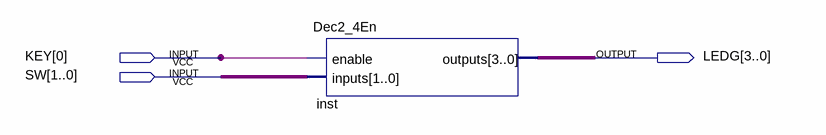
[diagram p0: schematic sheet]
// Quartus schematic Dec2_4En_1.bdf as structural Verilog: 1 symbols, 3 pins
module Dec2_4En_1 (
  input  [0:0] KEY,
  input  [1:0] SW,
  output [3:0] LEDG
);

  Dec2_4En inst (.enable(KEY[0]), .inputs(SW), .outputs(LEDG));
endmodule
